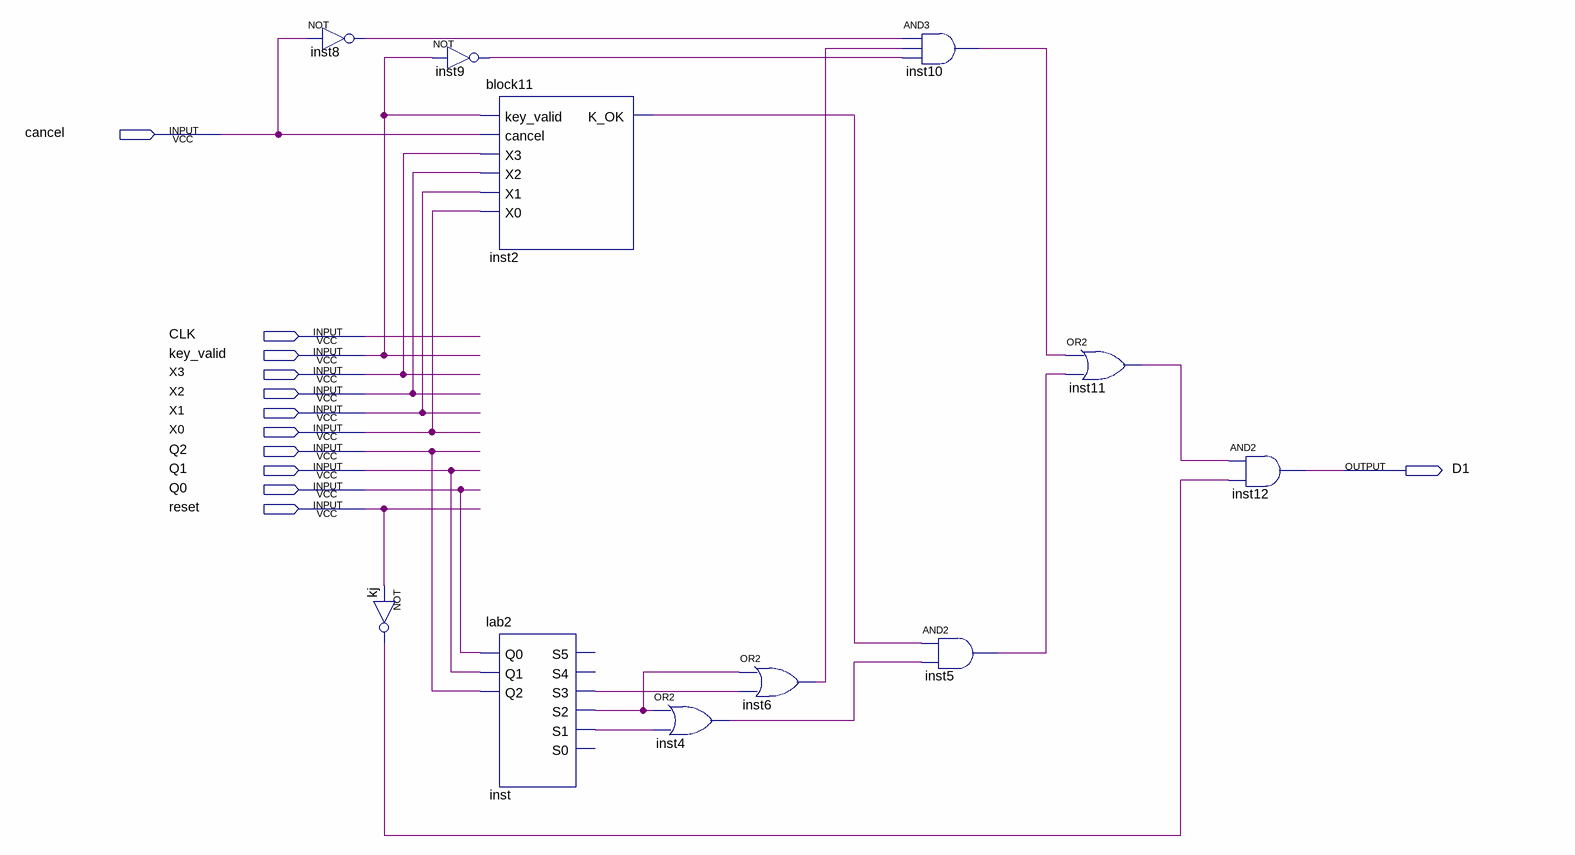
[diagram p0: schematic sheet]
// Quartus schematic block13.bdf as structural Verilog: 11 symbols, 12 pins
module block13 (
  input  cancel,
  input  CLK,
  input  key_valid,
  input  X3,
  input  X2,
  input  X1,
  input  X0,
  input  Q2,
  input  Q1,
  input  Q0,
  input  reset,
  output D1
);

  wire inst2_k_ok, inst4_out, inst5_out, inst6_out, inst8_out, inst9_out, inst10_out, inst11_out, inst_s1,
       inst_s2, inst_s3, kj_out;

  not inst8 (inst8_out, cancel);
  not kj (kj_out, reset);
  not inst9 (inst9_out, key_valid);
  block11 inst2 (.key_valid(key_valid), .cancel(cancel), .X3(X3), .X2(X2), .X1(X1), .X0(X0), .K_OK(inst2_k_ok));
  lab2 inst (.Q0(Q0), .Q1(Q1), .Q2(Q2), .S3(inst_s3), .S2(inst_s2), .S1(inst_s1));  // open: S5, S4, S0
  or inst4 (inst4_out, inst_s2, inst_s1);
  or inst6 (inst6_out, inst_s2, inst_s3);
  and inst10 (inst10_out, inst8_out, inst6_out, inst9_out);
  and inst5 (inst5_out, inst2_k_ok, inst4_out);
  or inst11 (inst11_out, inst10_out, inst5_out);
  and inst12 (D1, inst11_out, kj_out);
endmodule
